# Altium schematic sheet Temp_sensor.SchDoc: =DT_SCH_Title
size A4; Organization: Droid Technologies; SheetNumber: 8; SheetTotal: 22
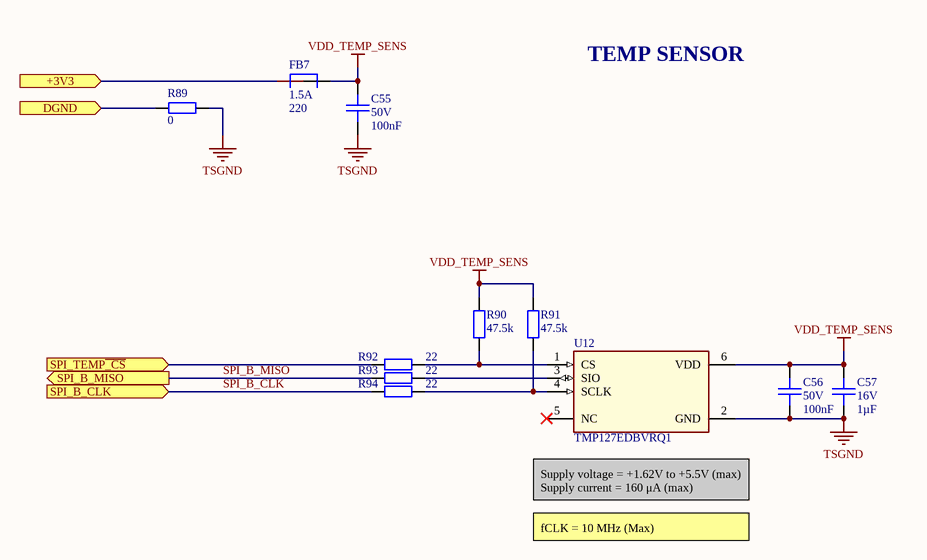
[diagram p0: Temp_sensor.SchDoc]

## Parts
C55  Voltage Rating: 50V  Capacitance: 100nF  [CAPC100x50x50L25]  (hidden comment: GCM155L8EH104KE07D)
C56  Voltage Rating: 50V  Capacitance: 100nF  [CAPC100x50x50L25]  (hidden comment: GCM155L8EH104KE07D)
C57  Voltage Rating: 16V  Capacitance: 1µF  [CAPC160X80X90L35]  (hidden comment: GCG188L8EE105KA07D)
FB7  Imax: 1.5A  Impedance: 220  [BEADC160X80X95L40]  (hidden comment: BLM18KG221BH1D)
R89  Resistance: 0  [RESC160X80X55L30]  (hidden comment: RC0603FR-070RL)
R90  Resistance: 47.5k  [RESC100X50X40L25]  (hidden comment: RC0402FR-0747K5L)
R91  Resistance: 47.5k  [RESC100X50X40L25]  (hidden comment: RC0402FR-0747K5L)
R92  Resistance: 22  [RESC100X50X40L25]  (hidden comment: RC0402FR-0722RL)
R93  Resistance: 22  [RESC100X50X40L25]  (hidden comment: RC0402FR-0722RL)
R94  Resistance: 22  [RESC100X50X40L25]  (hidden comment: RC0402FR-0722RL)
U12  TMP127EDBVRQ1  [SOT-23-6]

## Ports
+3V3 (in), DGND (in), SPI_B_CLK (in), SPI_B_MISO (out), SPI_TEMP~{_CS} (in)

## Nets
TSGND: C55.1 C56.1 C57.1 R89.1 U12.2(GND)
VDD_TEMP_SENS: C55.2 C56.2 C57.2 FB7.2 R90.2 R91.2 U12.6(VDD)
+3V3: FB7.1 ; port +3V3
DGND: R89.2 ; port DGND
SPI_B_CLK: R94.1 ; port SPI_B_CLK
SPI_B_MISO: R93.1 ; port SPI_B_MISO
SPI_TEMP~{_CS}: R92.1 ; port SPI_TEMP~{_CS}
NetR90_1: R90.1 R92.2 U12.1(CS)
NetR91_1: R91.1 R94.2 U12.4(SCLK)
NetR93_2: R93.2 U12.3(SIO)

Not connected (* = marked no-connect by the designer): U12 5(NC)*

## Notes on the sheet
- TEMP SENSOR
- (near U12) Supply voltage = +1.62V to +5.5V (max)
  Supply current = 160 μA (max)
- fCLK = 10 MHz (Max)
- Title
- Size:
- A4
- Number:
- Revision:
- Date:
- Time:
- Sheet
- of

## Library data of the parts
C55 C56 = CMP-001-1980-2: CAP CER 0.1UF 50V X8L 0402; Manufacturer: Murata Electronics; Op Temp max: 150°C; Op Temp min: -55°C; Tolerance: 10%; Height max: 550µm; ComponentLink3Description: Digikey; Mounting Type: SM; ComponentLink3URL: https://www.digikey.com/en/products/detail/murata-electronics/GCM155L8EH104KE07D/11618823; Package: 0402 (1005 Metric); Lead Spacing: 0mm; MPN: GCM155L8EH104KE07D; Size: 1.00mm x 0.50mm; Ratings: AEC-Q200; ComponentLink1URL: https://www.murata.com/en-us/products/productdetail?partno=GCM155L8EH104KE07%23; ComponentLink1Description: Datasheet; Dielectric: X8L; ComponentLink2Description: Mouser; ComponentLink2URL: https://eu.mouser.com/ProductDetail/Murata-Electronics/GCM155L8EH104KE07D?qs=1mbolxNpo8fQSHf0HYnZWw%3D%3D
C57 = CMP-001-1982-2: CAP CER 1UF 16V X8L 0603; Manufacturer: Murata Electronics; Tolerance: 10%; Op Temp min: -55°C; Op Temp max: 150°C; ComponentLink3URL: https://www.digikey.com/en/products/detail/murata-electronics/GCG188L8EE105KA07D/10695125; Package: 0603 (1608 Metric); MPN: GCG188L8EE105KA07D; ComponentLink2URL: https://eu.mouser.com/ProductDetail/Murata-Electronics/GCG188L8EE105KA07D?qs=rrS6PyfT74dFMfTR80dVTA%3D%3D; Dielectric: X8L; Size: 1.60mm x 0.80mm; ComponentLink1Description: Datasheet; ComponentLink1URL: https://www.murata.com/en-us/products/productdetail?partno=GCG188L8EE105KA07%23; ComponentLink2Description: Mouser; Height max: 900µm; Mounting Type: SM; ComponentLink3Description: Digikey; Lead Spacing: 0mm; Ratings: AEC-Q200
FB7 = CMP-001-1981-1: FERRITE BEAD 220 OHM 0603 1LN; Manufacturer: Murata Electronics; DCR: 50m; Op Temp min: -55°C; Frequency: 100MHz; Op Temp max: 150°C; Number of Lines: 1; Mounting Type: SM; Size: 1.60mm x 0.80mm; ComponentLink2URL: https://eu.mouser.com/ProductDetail/Murata-Electronics/BLM18KG221BH1D?qs=sJ5gq5MLFXpgEHYBdWUtkQ%3D%3D; ComponentLink1Description: Datasheet; ComponentLink1URL: https://www.murata.com/en-us/products/productdata/8798137286686/QNFA9129.pdf; Lead Spacing: 0mm; Ratings: AEC-Q200; ComponentLink3Description: Digikey; ComponentLink3URL: https://www.digikey.com/en/products/detail/murata-electronics/BLM18KG221BH1D/6156000; Height max: 950µm; Package: 0603 (1608 Metric); ComponentLink2Description: Mouser; MPN: BLM18KG221BH1D
R89 = CMP-001-0927-2: RES 0 OHM JUMPER 1/10W 0603; Manufacturer: YAGEO; Op Temp min: -55°C; Op Temp max: 155°C; Power: 100mW; Tolerance: 0%; Height max: 550µm; ComponentLink2URL: https://eu.mouser.com/ProductDetail/YAGEO/RC0603FR-070RL?qs=0yPvnVz5%2FmpDQv43TwvCfw%3D%3D; Temperature Coefficient: -; ComponentLink3Description: Digikey; ComponentLink2Description: Mouser; MPN: RC0603FR-070RL; ComponentLink1URL: https://www.yageo.com/upload/media/product/productsearch/datasheet/rchip/PYu-RC_Group_51_RoHS_L_12.pdf; Ratings: -; Size: 1.60mm x 0.80mm; Composition: Thick Film; Mounting Type: SM; ComponentLink3URL: https://www.digikey.com/en/products/detail/yageo/RC0603FR-070RL/1304008; Package: 0603 (1608 Metric); ComponentLink1Description: Datasheet
R90 R91 = CMP-001-0277-7: RES 47.5K OHM 1% 1/16W 0402; Manufacturer: YAGEO; Op Temp min: -55°C; Power: 63mW; Temperature Coefficient: ±100ppm; Op Temp max: 155°C; ComponentLink1URL: https://www.yageo.com/upload/media/product/productsearch/datasheet/rchip/PYu-RC_Group_51_RoHS_L_12.pdf; ComponentLink1Description: Datasheet; MPN: RC0402FR-0747K5L; ComponentLink3Description: Digikey; ComponentLink2URL: https://eu.mouser.com/ProductDetail/YAGEO/RC0402FR-0747K5L?qs=V1yeUXFNrklfu86Rfgihxg%3D%3D; Mounting Type: SM; Tolerance: 1%; Package: 0402 (1005 Metric); Height max: 400µm; ComponentLink2Description: Mouser; ComponentLink3URL: https://www.digikey.com/en/products/detail/yageo/RC0402FR-0747K5L/726617; Size: 1.00mm x 0.50mm; Composition: Thick Film; Ratings: -
R92-R94 = CMP-001-0482-4: RES 22 OHM 1% 1/16W 0402; Manufacturer: YAGEO; Temperature Coefficient: ±100ppm; Op Temp max: 155°C; Op Temp min: -55°C; Power: 63mW; Ratings: -; ComponentLink3URL: https://www.digikey.com/en/products/detail/yageo/RC0402FR-0722RL/726562; ComponentLink2URL: https://eu.mouser.com/ProductDetail/YAGEO/RC0402FR-0722RL?qs=V1yeUXFNrkkRg6zf08ADKQ%3D%3D; MPN: RC0402FR-0722RL; ComponentLink1Description: Datasheet; ComponentLink3Description: Digikey; Tolerance: 1%; Size: 1.00mm x 0.50mm; ComponentLink1URL: https://www.yageo.com/upload/media/product/productsearch/datasheet/rchip/PYu-RC_Group_51_RoHS_L_12.pdf; Composition: Thick Film; ComponentLink2Description: Mouser; Mounting Type: SM; Package: 0402 (1005 Metric); Height max: 400µm
U12 = TMP127EDBVRQ1: AUTOMOTIVE 0.8C SPI TEMPERATURE; Manufacturer: Texas Instruments; MPN: TMP127EDBVRQ1